# Altium schematic sheet POWER&USB_USART.SchDoc: Explorer STM32F407 Board
size A4; Author: ATOM@ALIENTEK; Revision: V3.4; SheetSize: A4
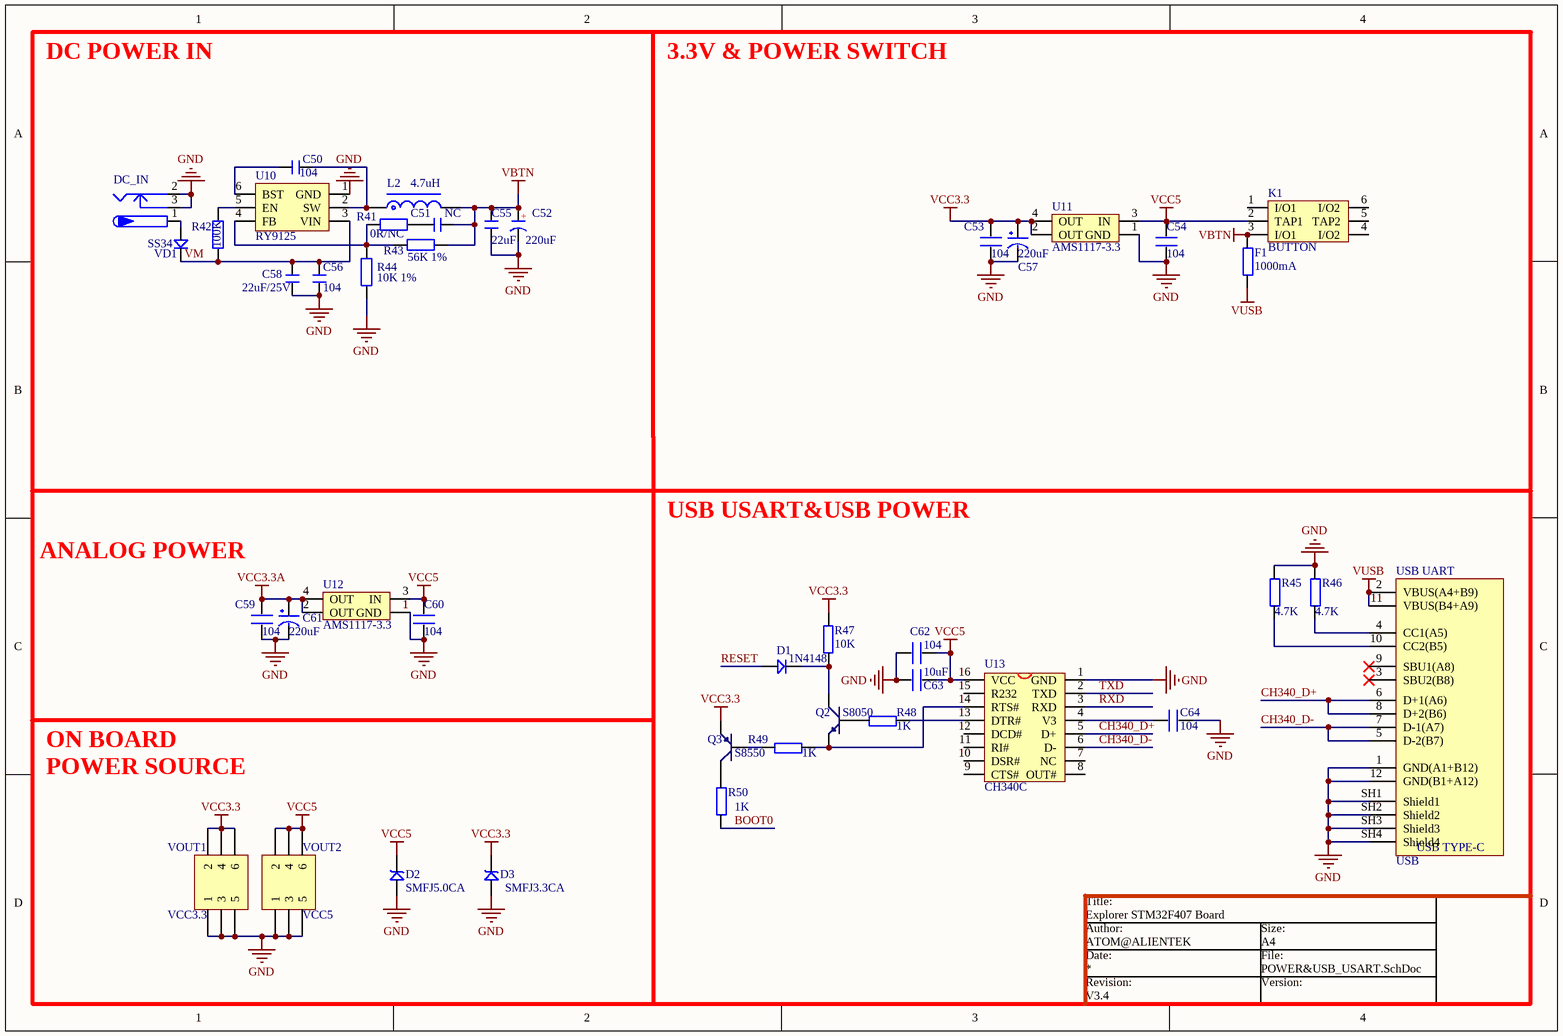
[diagram p0: POWER&USB_USART.SchDoc]

## Parts
C50  104  [0402]
C51  NC  [0402]
C52  220uF  [CM D(6.3*5.4)]
C53  104  [0402]
C54  104  [0402]
C55  22uF  [C 0805]
C56  104  [0402]
C57  220uF  [CC6.56.5]
C58  22uF/25V  [C 0805]
C59  104  [0402]
C60  104  [0402]
C61  220uF  [CC6.56.5]
C62  104  [0402]
C63  10uF  [0603P]
C64  104  [0402]
D1  1N4148  [DIODE_SOP]
D2  SMFJ5.0CA  [SOD-123]
D3  SMFJ3.3CA  [SOD-123]
DC_IN1  DC_IN  [DC10B]
F1  1000mA  [0805]
K1  BUTTON  [BTN8.5*8.5]
L2  4.7uH  [L-SMD-0420]
Q2  S8050  [SOT-23R]
Q3  S8550  [SOT-23R]
R41  0R/NC  [0402]
R42  100K  [0402]
R43  56K 1%  [0402]
R44  10K 1%  [0402]
R45  4.7K  [0402]
R46  4.7K  [0402]
R47  10K  [0402]
R48  1K  [0402]
R49  1K  [0402]
R50  1K  [0402]
U10  RY9125  [SOT23-6N]
U11  AMS1117-3.3  [AMS1117]
U12  AMS1117-3.3  [AMS1117]
U13  CH340C  [SOP16M]
USB_UART  USB  [USB Type-C]
VD1  SS34  [SMA]
VOUT1  VCC3.3  [HDR2X3]
VOUT2  VCC5  [HDR2X3]

## Nets
GND: C52.2(K) C53.1 C54.1 C55.2 C56.1 C57.2(GND) C58.1 C59.1 C60.1 C61.2(GND) C62.1 C63.1 C64.2 D2.1 D3.1 DC_IN1.2 DC_IN1.3 R44.2 R45.2 R46.2 U10.1(GND) U11.1(GND) U12.1(GND) U13.1(GND) USB_UART.1(GND(A1+B12)) USB_UART.12(GND(B1+A12)) USB_UART.SH1(Shield1) USB_UART.SH2(Shield2) USB_UART.SH3(Shield3) USB_UART.SH4(Shield4) VOUT1.1 VOUT1.3 VOUT1.5 VOUT2.1 VOUT2.3 VOUT2.5
VBTN: C51.2 C52.1(A) C55.1 F1.2 K1.3(I/O1) L2.2 R43.2
VCC3.3: C53.2 C57.1(VCC) D3.2 Q3.1(E) R47.1 U11.2(OUT) U11.4(OUT) VOUT1.2 VOUT1.4 VOUT1.6
VCC3.3A: C59.2 C61.1(VCC) U12.2(OUT) U12.4(OUT)
VCC5: C54.2 C60.2 C62.2 C63.2 D2.2 K1.2(TAP1) U11.3(IN) U12.3(IN) U13.16(VCC) VOUT2.2 VOUT2.4 VOUT2.6
VUSB: F1.1 USB_UART.2(VBUS(A4+B9)) USB_UART.11(VBUS(B4+A9))
BOOT0: R50.1
CH340_D+: U13.5(D+) USB_UART.6(D+1(A6)) USB_UART.8(D+2(B6))
CH340_D-: U13.6(D-) USB_UART.5(D-2(B7)) USB_UART.7(D-1(A7))
RESET: D1.1
RXD: U13.3(RXD)
TXD: U13.2(TXD)
VM: C56.2 C58.2 R42.2 U10.3(VIN) VD1.2(K)
NetC50_1: C50.1 U10.6(BST)
NetC50_2: C50.2 L2.1 U10.2(SW)
NetC51_1: C51.1 R41.2
NetC64_1: C64.1 U13.4(V3)
NetD1_2: D1.2 Q2.3(C) R47.2
NetDC_IN1_1: DC_IN1.1 VD1.1(A)
NetQ2_1: Q2.1(E) R49.2 U13.14(RTS#)
NetQ2_2: Q2.2(B) R48.1
NetQ3_2: Q3.2(B) R49.1
NetQ3_3: Q3.3(C) R50.2
NetR41_1: R41.1 R43.1 R44.1 U10.4(FB)
NetR42_1: R42.1 U10.5(EN)
NetR45_1: R45.1 USB_UART.10(CC2(B5))
NetR46_1: R46.1 USB_UART.4(CC1(A5))
NetR48_2: R48.2 U13.13(DTR#)

Not connected (* = marked no-connect by the designer): K1 1(I/O1) 4(I/O2) 5(TAP2) 6(I/O2); U13 7(NC) 8(OUT#) 9(CTS#) 10(DSR#) 11(RI#) 12(DCD#) 15(R232); USB_UART 3(SBU2(B8))* 9(SBU1(A8))*

## Notes on the sheet
- DC POWER IN
- 3.3V & POWER SWITCH
- USB USART&USB POWER
- ANALOG POWER
- POWER SOURCE
- ON BOARD
- Title:
- Author:
- Date:
- Revision:
- Size:
- File:
- Version:
- (in symbol C-CM) +
- (in symbol USB Type-C) USB TYPE-C

## Library data of the parts
C50 C51 C55 = C: 无极性贴片电容; 版权归属: 源创客; BOM名称: 无极性贴片电容; 学习资源: www.ooocke.com
C52 = C-CM: 贴片电解电容; 版权归属: 源创客; BOM名称: 贴片电解电容; 学习资源: www.ooocke.com
C53 C54 C59 C60 C62-C64 = C
C56 C58 = C: 无极性贴片电容,25V; 版权归属: 源创客; BOM名称: 无极性贴片电容; 学习资源: www.ooocke.com
C57 C61 = CAP
D1 = D
D2 D3 = SMBJ: TVS
DC_IN1 = P-DC: 低压电源接口; BOM名称: DC电源接口; 版权归属: 源创客; 学习资源: www.ooocke.com
F1 R45-R50 = R
L2 = L-CDRH: 功率屏蔽电感; 版权归属: 源创客; BOM名称: 功率屏蔽电感; 学习资源: www.ooocke.com
Q2 = NPN: 8050/BCW846/BCW847
Q3 = PNP: 8550/BCW68
R41-R44 = R: 贴片电阻; 版权归属: 源创客; BOM名称: 贴片电阻; 学习资源: www.ooocke.com
U10 = DC JW5060T_6: DC降压芯片
U11 U12 = AMS1117
U13 = CH340C: USB2UART
USB_UART = USB Type-C: 12P TypeC 母座
VD1 = SS14: 肖特基二极管; 版权归属: 源创客; 属性: 40V/1A; BOM名称: 肖特基二极管; 学习资源: www.ooocke.com
VOUT1 VOUT2 = Header 3X2: Header, 3-Pin, Dual row; LatestRevisionDate: 17-Jul-2002; LatestRevisionNote: Re-released for DXP Platform.; Publisher: Altium Limited